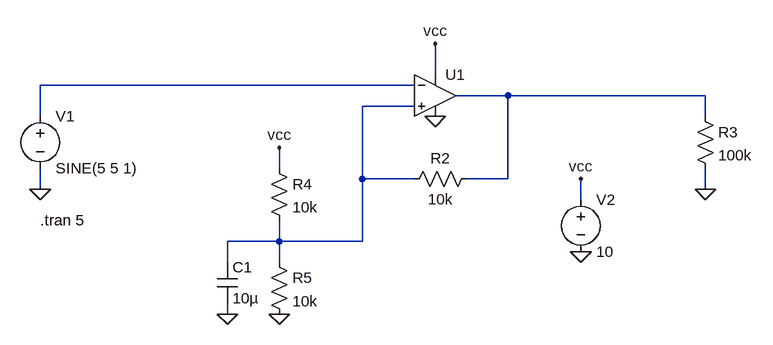
[diagram p0: schematic Schmitt Trigger.asc]
Schmitt Trigger.asc, the LTspice schematic file:
Version 4.1
SHEET 1 880 708
WIRE 240 128 240 80
WIRE 208 144 -368 144
WIRE 352 160 272 160
WIRE 656 160 352 160
WIRE 208 176 128 176
WIRE -368 192 -368 144
WIRE 656 192 656 160
WIRE 0 272 0 240
WIRE 128 288 128 176
WIRE 208 288 128 288
WIRE 352 288 352 160
WIRE 352 288 288 288
WIRE -368 304 -368 272
WIRE 656 304 656 272
WIRE 464 320 464 288
WIRE 0 384 0 352
WIRE 0 384 -80 384
WIRE 128 384 128 288
WIRE 128 384 0 384
WIRE -80 416 -80 384
WIRE 0 416 0 384
WIRE -80 496 -80 480
FLAG 240 192 0
FLAG -368 304 0
FLAG 656 304 0
FLAG 240 80 vcc
FLAG 464 400 0
FLAG 464 288 vcc
FLAG 0 496 0
FLAG -80 496 0
FLAG 0 240 vcc
SYMBOL OpAmps\\UniversalOpAmp2 240 160 R0
SYMATTR InstName U1
SYMBOL res 304 272 R90
WINDOW 0 0 56 VBottom 2
WINDOW 3 32 56 VTop 2
SYMATTR InstName R2
SYMATTR Value 10k
SYMBOL res 640 176 R0
SYMATTR InstName R3
SYMATTR Value 100k
SYMBOL voltage -368 176 R0
WINDOW 123 0 0 Left 0
WINDOW 39 0 0 Left 0
SYMATTR InstName V1
SYMATTR Value SINE(5 5 1)
SYMBOL voltage 464 304 R0
WINDOW 123 0 0 Left 0
WINDOW 39 0 0 Left 0
SYMATTR InstName V2
SYMATTR Value 10
SYMBOL res -16 256 R0
SYMATTR InstName R4
SYMATTR Value 10k
SYMBOL res -16 400 R0
SYMATTR InstName R5
SYMATTR Value 10k
SYMBOL cap -96 416 R0
SYMATTR InstName C1
SYMATTR Value 10µ
TEXT -368 352 Left 2 !.tran 5

The netlist it stands for:
* Schmitt Trigger.asc
X§U1 N003 N001 vcc 0 N002 level2 Avol=1Meg GBW=10Meg Slew=10Meg Ilimit=25m Rail=0 Vos=0 En=0 Enk=0 In=0 Ink=0 Rin=500Meg  ; pins In+ In- V+ V- OUT
R2 N002 N003 10k
R3 N002 0 100k
V1 N001 0 SINE(5 5 1)
V2 vcc 0 10
R4 vcc N003 10k
R5 N003 0 10k
C1 N003 0 10µ
.tran 5
.lib UniversalOpAmp2.lib
.backanno
.end